# EAGLE design MPU-9250-breakout (EAGLE 9.6.1)
REVISION: 1.0; SCH_DESC: Breakout board for the LSM9DS1; TEAM: RoboCup
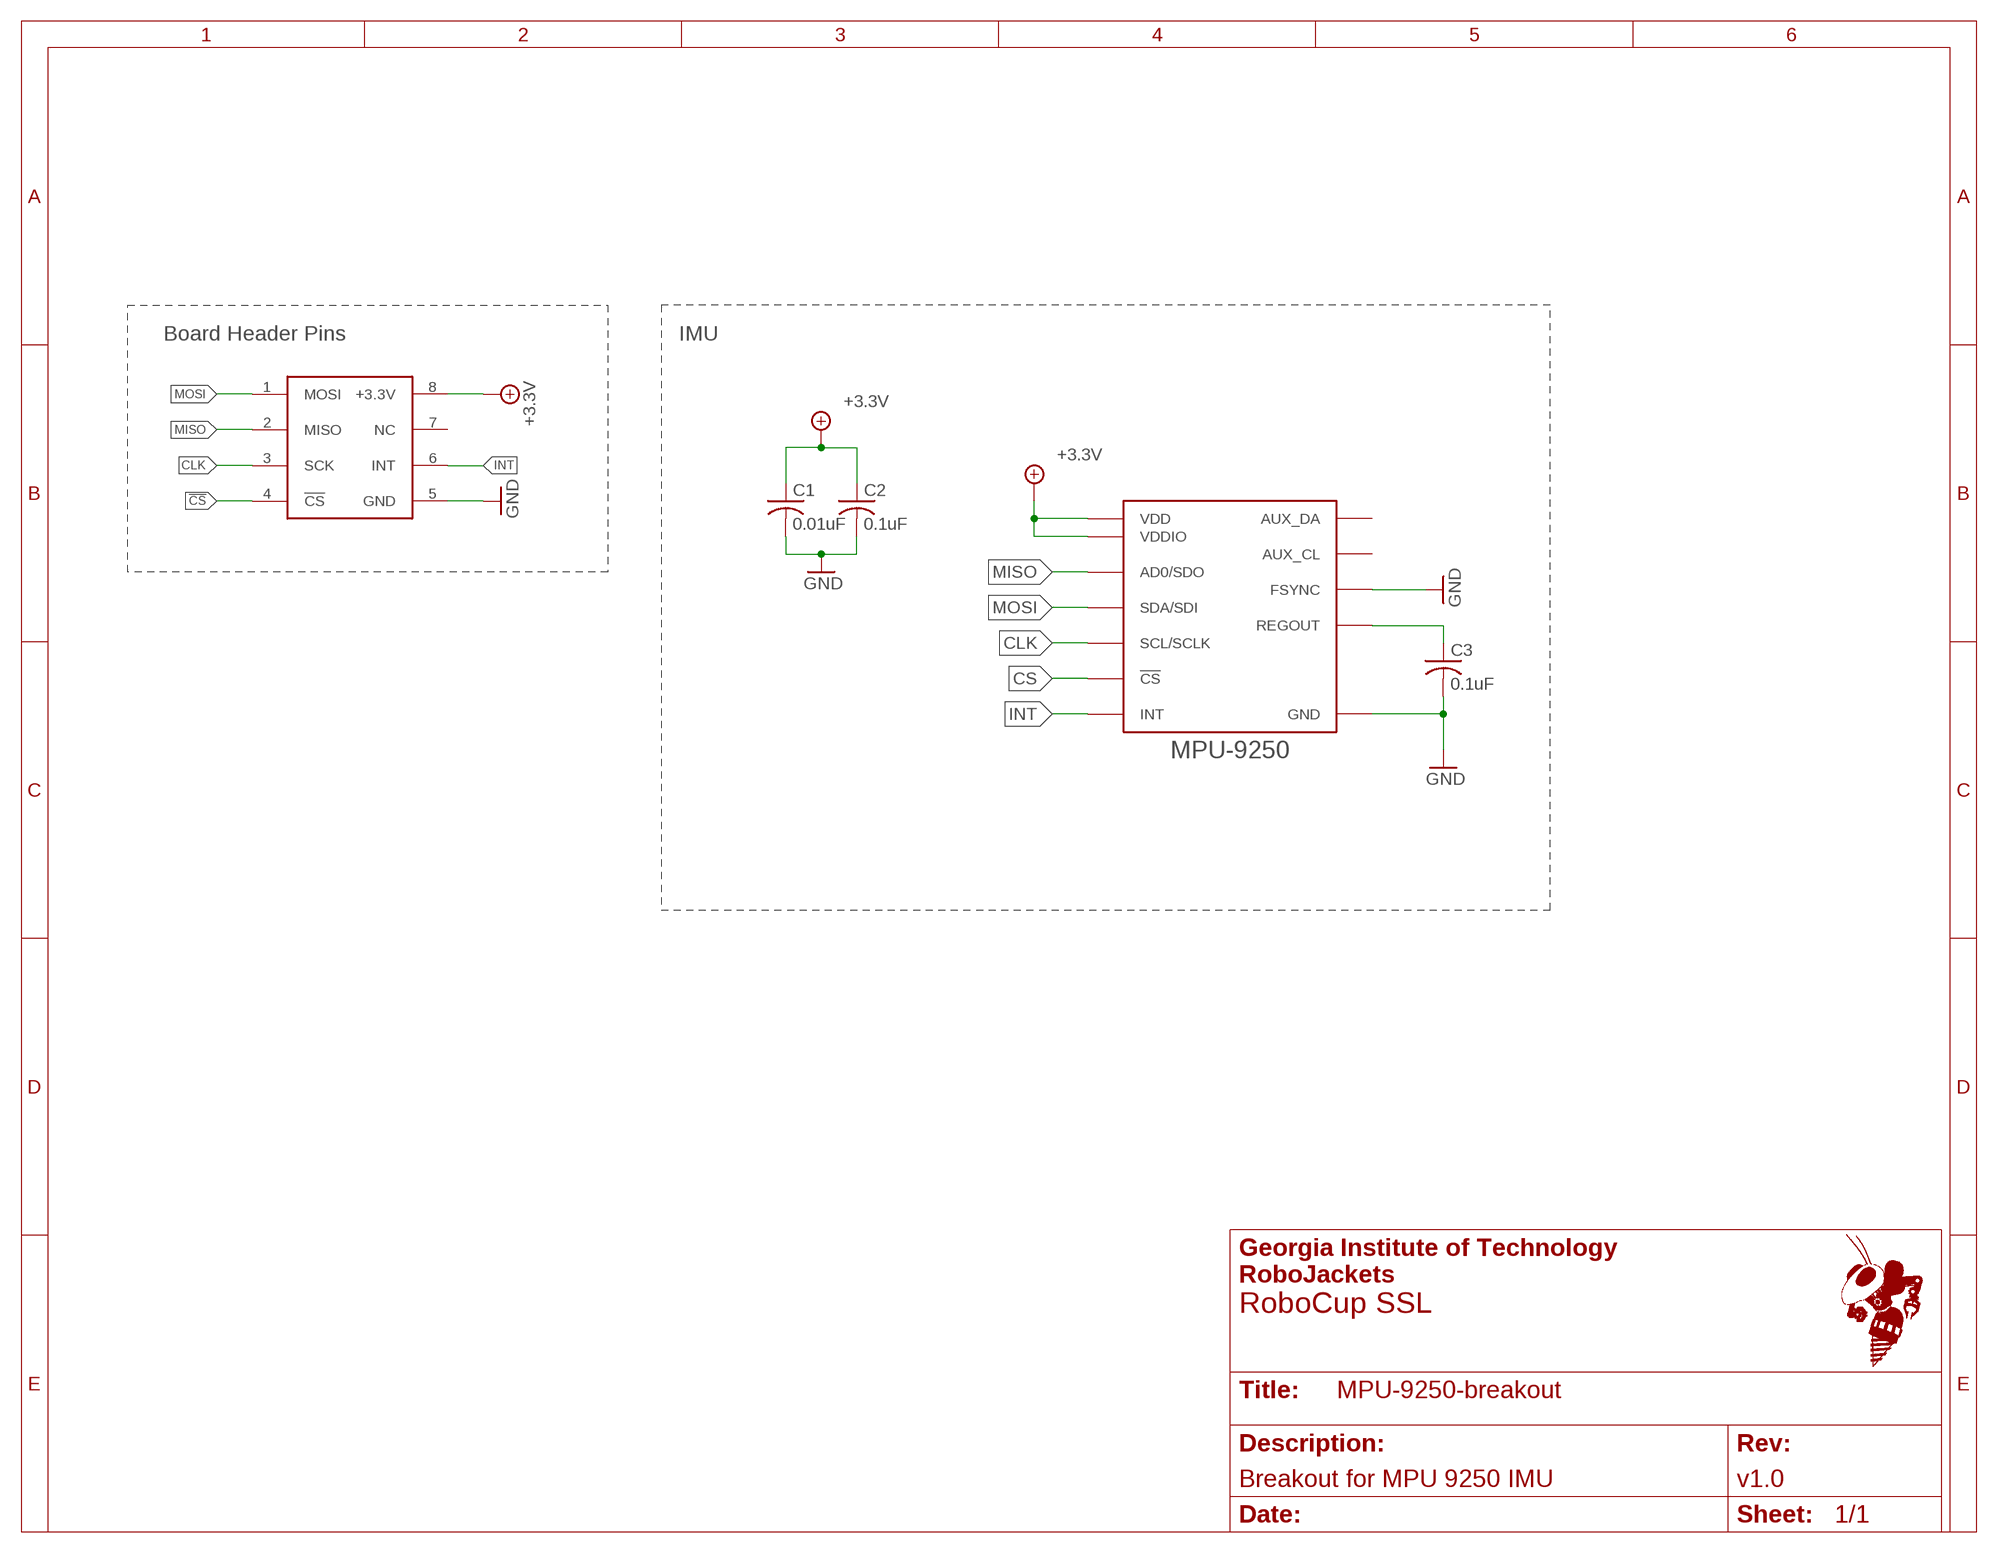
[diagram p0: schematic, sheet 1]
FRAME1 (FRAME_A_L): REVISION: v1.0; SCH_DESC: Breakout for MPU 9250 IMU; TEAM: RoboCup SSL

## Parts
C1  0.01uF  C-USC0603  [C0603]
C2  0.1uF  C-USC0603  [C0603]
C3  0.1uF  C-USC0603  [C0603]
IC1  MPU-9250  [QFN-24-4MM2]
KIT1  IMUIMU-KIT  [IMU-KIT]

## Nets
!CS!: KIT1.4(!CS!)
+3.3V: C1.1 C2.1 IC1.1(VDDIO) IC1.8(VDDIO) IC1.13(VDD) KIT1.8(+3.3V)
CLK: IC1.23(SCL/SCLK) KIT1.3(SCK)
CS: IC1.22(!CS!)
GND: C1.2 C2.2 C3.2 IC1.11(FSYNC) IC1.18(GND) IC1.20(GND) KIT1.5(GND)
INT: IC1.12(INT) KIT1.6(INT)
MISO: IC1.9(AD0/SDO) KIT1.2(MISO)
MOSI: IC1.24(SDA/SDI) KIT1.1(MOSI)
N$1: C3.1 IC1.10(REGOUT)
Unconnected: IC1.7(AUX_CL) IC1.21(AUX_DA) KIT1.7(NC)

## Notes on the sheet
- Board Header Pins | IMU

## Library data of the parts
C1-C3 = rcl:C-US: CAPACITOR, American symbol; SPICEPREFIX: C
IC1 = RoboJackets-Sensors:MPU-9250: http://www.invensense.com/mems/gyro/documents/PS-MPU-9250A-01.pdf
KIT1 = RoboJackets-Boards:IMU: IMU breakout board

## Board
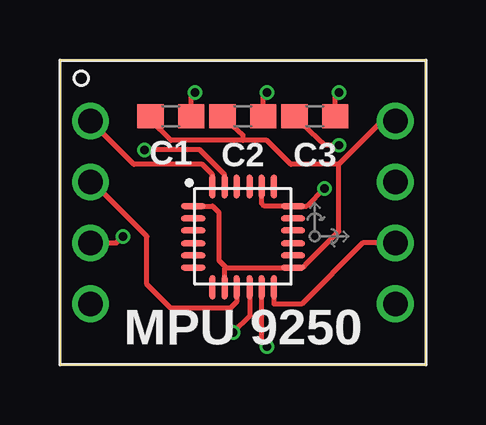
[diagram p1: board, top side]
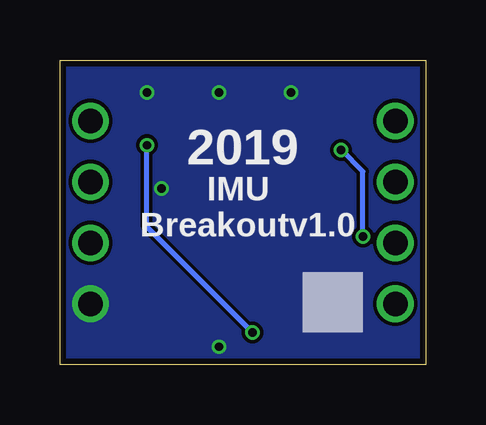
[diagram p2: board, bottom side, seen from below]

Size 15.24 x 12.7 mm. Coordinates in mm from the lower left corner, seen from the top.
Outline: 0,0 15.24,0 15.24,12.7 0,12.7 0,0
Copper layers (1*16): Top 0.018mm / dielectric 1.55mm / Bottom 0.018mm
Design rules "eC_2Layer_PClass6_BaseCopperO18_eCDefault": minimum track width 0.15mm, minimum drill 0.35mm, track to track 0.15mm, track to pad 0.15mm, pad to pad 0.15mm, via to via 0.15mm, smd to smd 0mil, copper to edge 0.25mm, drill to drill 0.35mm, minimum pad ring 0.175mm, minimum via ring 0.125mm, stop-mask expansion 0mil, vias tented up to drill 0.45mm, thermal gap 0.2mm

### Footprints (pad centres in the part's own frame; a part is rotated, then mirrored left to right if it is on the bottom)
C0603 = smd 1.1 x 1: 1 -0.85,0; 2 0.85,0
QFN-24-4MM2 = smd 1.016 x 0.254: 1 -2.066,1.257; 2 -2.066,0.75; 3 -2.066,0.247; 4 -2.066,-0.287; 5 -2.066,-0.792; 6 -2.066,-1.297; 13 2.086,-1.297; 14 2.086,-0.792; 15 2.086,-0.287; 16 2.086,0.247; 17 2.086,0.75; 18 2.086,1.257 | smd 0.254 x 1.016: 7 -1.267,-2.122; 8 -0.762,-2.122; 9 -0.258,-2.122; 10 0.278,-2.122; 11 0.78,-2.122; 12 1.287,-2.122; 19 1.287,2.082; 20 0.78,2.082; 21 0.278,2.082; 22 -0.258,2.082; 23 -0.762,2.082; 24 -1.267,2.082
IMU-KIT = drill 1.02: 1 -6.35,3.81; 2 -6.35,1.27; 3 -6.35,-1.27; 4 -6.35,-3.81; 5 6.35,-3.81; 6 6.35,-1.27; 7 6.35,1.27; 8 6.35,3.81

### Placement (x,y rotation side)
C1  4.62,10.35 0 top
C2  7.62,10.35 0 top
C3  10.62,10.35 0 top
IC1  7.62,5.35 0 top
KIT1  7.62,6.35 0 top

### Tracks (layer width: path | path; a pad name or v marks a point on that pad's centre or on a via)
+3.3V
  Top 0.2: IC1.1 6.36,6.61 6.62,6.35 6.62,4.35 6.92,4.05 | 6.92,4.05 9.62,4.05 IC1.13 10.12,4.05 10.24,4.18 10.52,4.45 11.62,5.56 11.62,8.35 | IC1.8 6.86,3.99 6.92,4.05 | 11.62,8.35 13.43,10.16 KIT1.8 | 7.62,9.35 8.62,9.35 9.62,8.35 11.62,8.35 | 7.62,9.35 4.62,9.35 3.77,10.2 C1.1 | C2.1 7.62,9.58 7.62,9.35
CLK  (via drill 0.35)
  Top 0.2: KIT1.3 2.35,5.08 v2.62,5.35 | IC1.23 6.86,7.92 5.83,8.96 v3.53,8.96
  Bottom 0.2: v2.62,5.35 2.62,8.05 v3.53,8.96
GND  (via drill 0.35)
  Top 0.2: IC1.20 8.4,6.72 8.52,6.61 IC1.18 10.28,6.61 v11.02,7.35 | C3.2 11.47,11.2 v11.62,11.35 | C2.2 8.47,11.2 v8.62,11.35 | C1.2 5.47,11.2 v5.62,11.35 | v8.62,0.75 8.4,0.97 IC1.11
  pour Bottom (no thermals): 0,12.7 15.24,12.7 15.24,0 0,0
INT
  Top 0.2: KIT1.6 12.62,5.08 10.07,2.53 8.91,2.53 IC1.12
MISO
  Top 0.2: KIT1.2 1.35,7.62 3.62,5.35 3.62,3.35 4.62,2.35 7.09,2.35 7.36,2.62 IC1.9
MOSI
  Top 0.2: IC1.24 6.35,7.93 5.94,8.35 3.08,8.35 KIT1.1
N$1  (via drill 0.35)
  Top 0.2: IC1.10 7.9,2.03 v7.22,1.35 | C3.1 11.05,9.15 v11.62,9.15
  Bottom 0.2: v7.22,1.35 11.62,5.75 v11.62,9.15

### Text on the board
tPlace: MPU 9250
bPlace: 2019 | IMU / Breakout